# Altium schematic sheet 12_Audio_Connector.SchDoc
size A3; SheetNumber: 3; SheetTotal: 15
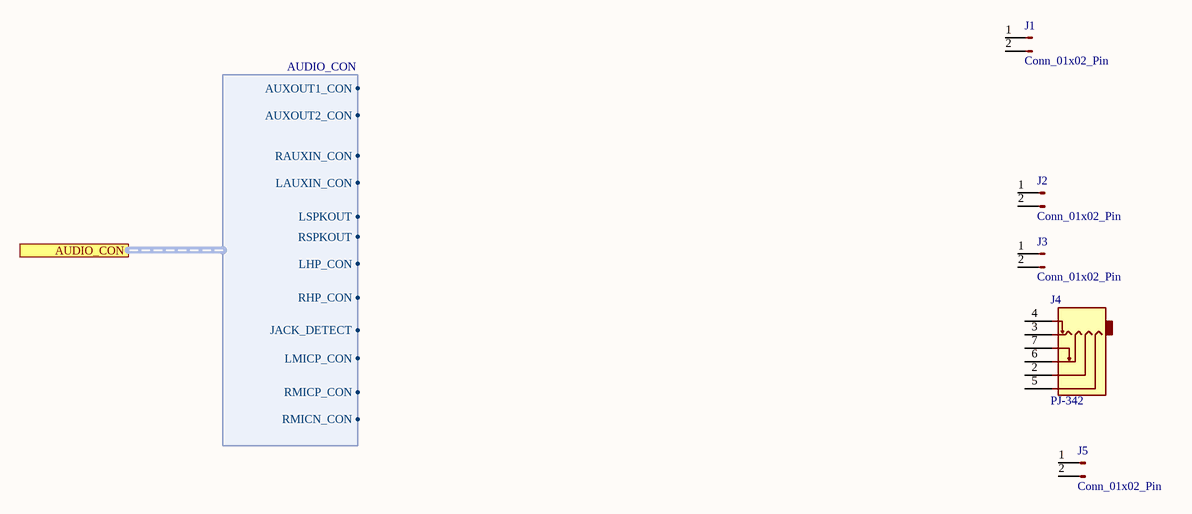
[diagram p0: 12_Audio_Connector.SchDoc]

## Parts
J1  Conn_01x02_Pin
J2  Conn_01x02_Pin
J3  Conn_01x02_Pin
J4  value PJ-342  [PJ-342]  (hidden comment: AudioJack4_SwitchTR1)
J5  Conn_01x02_Pin

## Ports
AUDIO_CON (harness AUDIO_CON, see SBC_SCH[6B], Audio_CODEC[8B])

## Harnesses
AUDIO_CON: AUXOUT1_CON, AUXOUT2_CON, RAUXIN_CON, LAUXIN_CON, LHP_CON, RHP_CON, LMICP_CON, RMICP_CON, RMICN_CON, LSPKOUT, RSPKOUT, JACK_DETECT

## Nets

Not connected (* = marked no-connect by the designer): J1 1(Pin_1) 2(Pin_2); J2 1(Pin_1) 2(Pin_2); J3 1(Pin_1) 2(Pin_2); J4 2(R2) 3(T) 4(TN) 5 6(R1) 7(R1N); J5 1(Pin_1) 2(Pin_2)

## Library data of the parts
J1-J3 J5 = Conn_01x02_Pin: Generic connector, single row, 01x02, script generated
J4 = PJ-342: 3.5mm Headphone Jack 30V 500mA Copper Gold SMD Audio Connectors ROHS; Manufacturer_Name: SHOU HAN; Manufacturer_Part_Number: PJ-342